# EasyEDA Pro project harvesp-rev-a.epro

# Schematic Schematic1_1
Board Name: Board1_1; Create Date: 2026-04-22; Page Name: P1; Project Name: harvesp; Schematic Name: Schematic1_1; Update Date: 2026-04-30; Company: EasyEDA.com; Page Size: A4; Version: V1.0
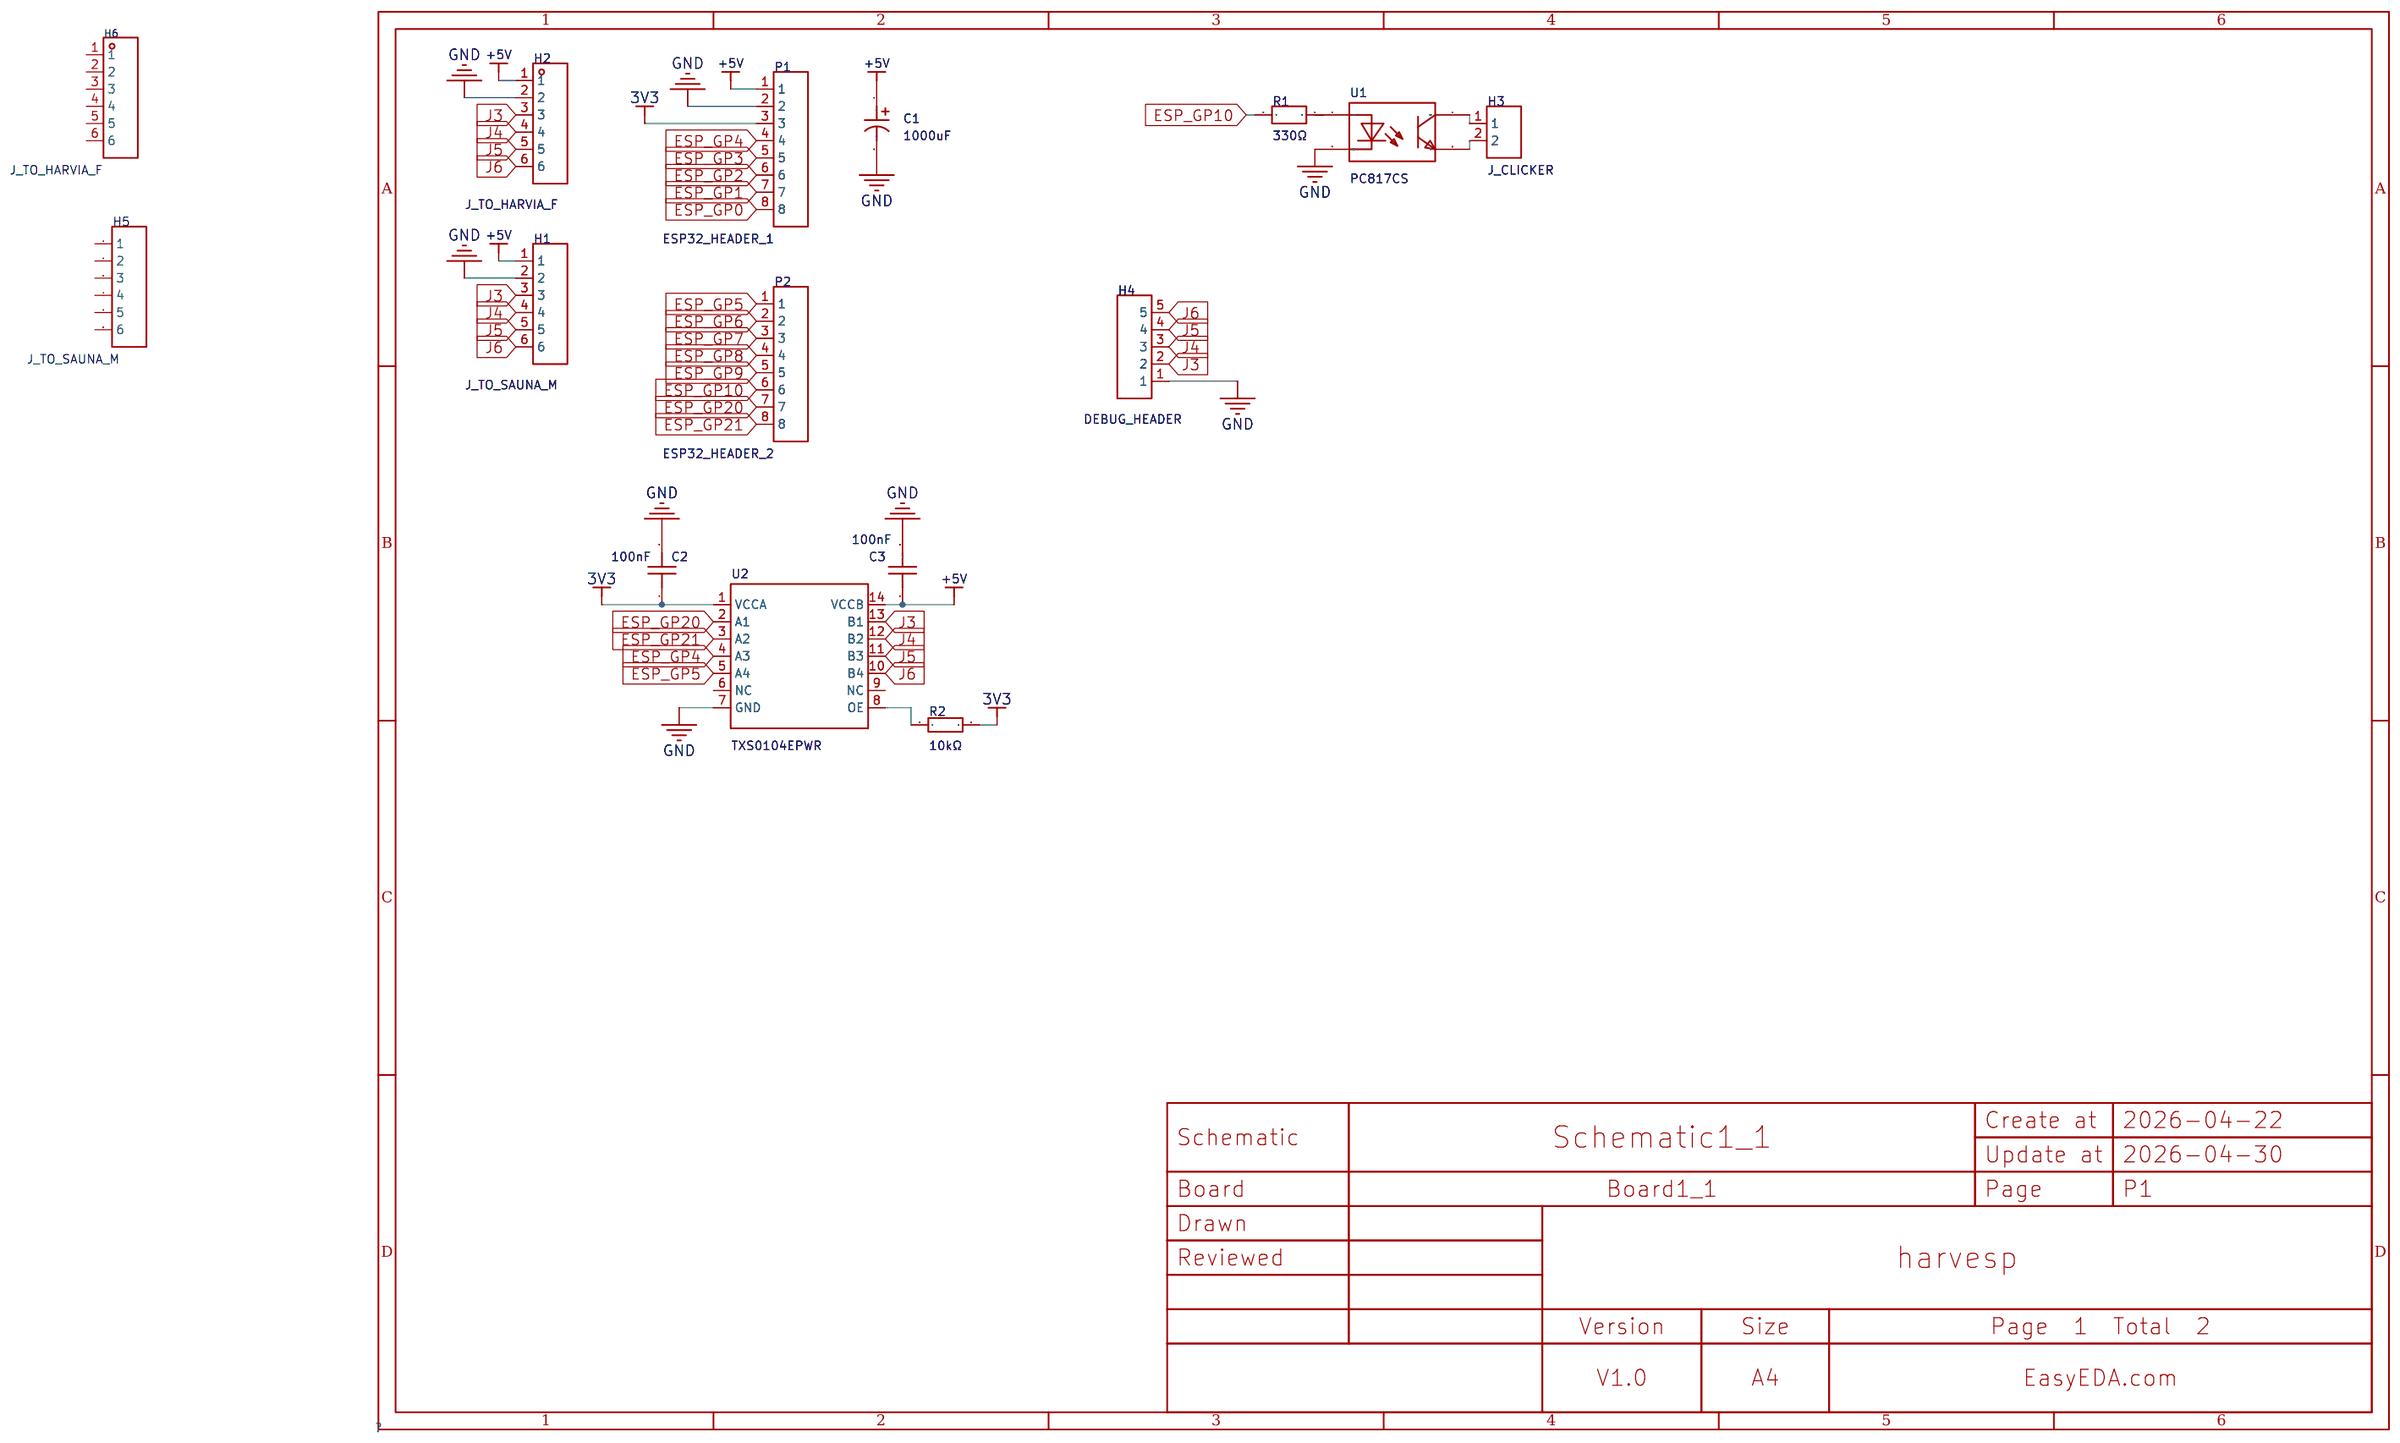
[diagram p0: schematic sheet]

## Parts
C1  1000uF  [CAP-SMD_BD8.0-L8.3-W8.3-LS9.0-FD]
C2  100nF  [C0603]
C3  100nF  [C0603]
H1  J_TO_SAUNA_M  [HDR-TH_6P-P2.54-H-M-W10.4]
H2  J_TO_HARVIA_F  [HDR-TH_6P-P2.54-H-F-W10.0-N]
H3  J_CLICKER  [HDR-TH_2P-P2.54-V-M]
H4  DEBUG_HEADER  [HDR-TH_5P-P2.54-V-M]
H5  J_TO_SAUNA_M  [HDR-TH_6P-P2.54-V-M-1]  (no BOM)
H6  J_TO_HARVIA_F  [HDR-TH_6P-P2.54-V-F]  (no BOM)
P1  ESP32_HEADER_1  [HDR-TH_8P-P2.54-V-F]
P2  ESP32_HEADER_2  [HDR-TH_8P-P2.54-V-F]
R1  330Ω  [R0805]
R2  10kΩ  [R0603]
U1  PC817CS  [SOP-4_L6.5-W4.6-P2.54-LS10.2-BL]
U2  TXS0104EPWR  [TSSOP-14_L5.0-W4.4-P0.65-LS6.4-BL]

## Library data of the parts
C1 = JVJ6.3V1000M8X10: Capacitance:1000uF Tolerance:±20% Tolerance:±20% Voltage Rating:6.3V Ripple Current:230mA@120Hz Diameter:8mm Height - Seated (Max):10.5mm Lifetime:2000hrs@105℃ Operating Temperature:-55℃~+105℃ Operating Temperature:-55℃~+105℃; LCSC Part Name: 1000uF ±20% 6.3V; Supplier Part: C49256842; Manufacturer: JIERR(捷而瑞); Supplier Footprint: SMD,D8xL10.5mm; JLCPCB Part Class: Extended Part; Datasheet: https://item.szlcsc.com/datasheet/JVJ6.3V1000M8X10/51692242.html; Supplier: LCSC; Tolerance: ±20%; Voltage Rating: 6.3V; Ripple Current: 230mA@120Hz; Diameter: 8mm; Height - Seated (Max): 10.5mm; Lifetime: 2000hrs@105℃; Operating Temperature: -55℃~+105℃
C2 C3 = TCC0603X7R104K500CT: Capacitance:100nF Tolerance:±10% Tolerance:±10% Voltage Rating:50V Temperature Coefficient:X7R; LCSC Part Name: 100nF ±10% 50V; Supplier Part: C282519; Manufacturer: CCTC(三环); Supplier Footprint: 0603; JLCPCB Part Class: Extended Part; Datasheet: https://item.szlcsc.com/datasheet/TCC0603X7R104K500CT/268639.html; Supplier: LCSC; Tolerance: ±10%; Voltage Rating: 50V; Temperature Coefficient: X7R
H1 = PZ254R-11-06P: Pin Structure:1x6P Pitch:2.54mm Row Spacing:- Circluar Pins/Square Pins:Pin Header Mounting Type:Right Angle Number of Rows:1 Number of Pins:6P Current Rating:3A Voltage Rating (Max):250V Length of Mating Pin:6mm Insulation Height:2.5mm Length of End Conn; LCSC Part Name: 1x6P 间距:2.54mm 方针 弯插; Supplier Part: C492414; Manufacturer: XFCN(兴飞); Supplier Footprint: 弯插,P=2.54mm; JLCPCB Part Class: Extended Part; Datasheet: https://item.szlcsc.com/datasheet/PZ254R-11-06P/502970.html; Supplier: LCSC; Pin Structure: 1x6P; Pitch: 2.54mm; Circluar Pins/Square Pins: Pin Header; Mounting Type: Right Angle; Number of Rows: 1; Number of Pins: 6P; Current Rating: 3A; Voltage Rating (Max): 250V; Length of Mating Pin: 6mm; Insulation Height: 2.5mm; Contact Material: Brass; Operating Temperature: -40℃~+105℃; Color: Black
H2 = PM254-1-06-W-8.5: Holes Structure:1x6P Pitch:2.54mm Row Spacing:- Circular Hole / Square Hole:Square Hole Mounting Type:Right Angle Number of Rows:1 Number of Positions:6P Current Rating:3A Voltage Rating (Max):- Holes Direction:Side Insulation Height:8.5mm Contact Materia; LCSC Part Name: 1x6P 间距:2.54mm 弯插; Supplier Part: C2897388; Manufacturer: HCTL(华灿天禄); Supplier Footprint: 弯插,P=2.54mm; JLCPCB Part Class: Extended Part; Datasheet: https://item.szlcsc.com/datasheet/PM254-1-06-W-8.5/3142393.html; Supplier: LCSC; Holes Structure: 1x6P; Pitch: 2.54mm; Circular Hole / Square Hole: Square Hole; Mounting Type: Right Angle; Number of Rows: 1; Number of Positions: 6P; Current Rating: 3A; Holes Direction: Side; Insulation Height: 8.5mm; Contact Material: Copper Alloy; Operating Temperature: -40℃~+105℃
H3 = PZ254V-11-02P: Pin Structure:1x2P Pitch:2.54mm Row Spacing:- Circluar Pins/Square Pins:Pin Header Mounting Type:Through Hole Number of Rows:1 Number of Pins:2P Current Rating:3A Voltage Rating (Max):250V Length of Mating Pin:6mm Insulation Height:2.5mm Length of End Con; LCSC Part Name: 1x2P 间距:2.54mm 方针 直插; Supplier Part: C492401; Manufacturer: XFCN(兴飞); Supplier Footprint: 插件,P=2.54mm; JLCPCB Part Class: Extended Part; Datasheet: https://item.szlcsc.com/datasheet/PZ254V-11-02P/502957.html; Supplier: LCSC; Pin Structure: 1x2P; Pitch: 2.54mm; Circluar Pins/Square Pins: Pin Header; Mounting Type: Through Hole; Number of Rows: 1; Number of Pins: 2P; Current Rating: 3A; Voltage Rating (Max): 250V; Length of Mating Pin: 6mm; Insulation Height: 2.5mm; Length of End Connection Pin: 3mm; Contact Material: Brass; Operating Temperature: -40℃~+105℃; Color: Black
H4 = PZ254V-11-05P: Pin Structure:1x5P Pitch:2.54mm Row Spacing:- Circluar Pins/Square Pins:Pin Header Mounting Type:Through Hole Number of Rows:1 Number of Pins:5P Current Rating:3A Voltage Rating (Max):250V Length of Mating Pin:6mm Insulation Height:2.5mm Length of End Con; LCSC Part Name: 1x5P 间距:2.54mm 方针 直插; Supplier Part: C492404; Manufacturer: XFCN(兴飞); Supplier Footprint: 插件,P=2.54mm; JLCPCB Part Class: Extended Part; Datasheet: https://item.szlcsc.com/datasheet/PZ254V-11-05P/502960.html; Supplier: LCSC; Pin Structure: 1x5P; Pitch: 2.54mm; Circluar Pins/Square Pins: Pin Header; Mounting Type: Through Hole; Number of Rows: 1; Number of Pins: 5P; Current Rating: 3A; Voltage Rating (Max): 250V; Length of Mating Pin: 6mm; Insulation Height: 2.5mm; Length of End Connection Pin: 3mm; Contact Material: Brass; Operating Temperature: -40℃~+105℃; Color: Black
H5 = 2.54-1x6P直针: Pin Structure:1x6P Pitch:2.54mm Row Spacing:- Circluar Pins/Square Pins:Pin Header Mounting Type:Through Hole Number of Rows:1 Number of Pins:6P Current Rating:3A Voltage Rating (Max):- Length of Mating Pin:6mm Insulation Height:2.5mm Length of End Connec; LCSC Part Name: 1x6P 间距:2.54mm 方针 直插; Supplier Part: C37208; Manufacturer: BOOMELE(博穆精密); Supplier Footprint: 插件,P=2.54mm; JLCPCB Part Class: Extended Part; Datasheet: https://item.szlcsc.com/datasheet/2.54-1x6P%25E7%259B%25B4%25E9%2592%2588/38187.html; Supplier: LCSC; Pin Structure: 1x6P; Pitch: 2.54mm; Circluar Pins/Square Pins: Pin Header; Mounting Type: Through Hole; Number of Rows: 1; Number of Pins: 6P; Current Rating: 3A; Length of Mating Pin: 6mm; Insulation Height: 2.5mm; Length of End Connection Pin: 3mm; Contact Material: Brass; Contact Plating: Gold; Operating Temperature: -40℃~+105℃; Color: Black
H6 = PM254V-11-06-H85: Holes Structure:1x6P Pitch:2.54mm Row Spacing:- Circular Hole / Square Hole:Square Hole Mounting Type:Through Hole Number of Rows:1 Number of Positions:6P Current Rating:3A Voltage Rating (Max):250V Holes Direction:Top Insulation Height:- Operating Temper; LCSC Part Name: 间距:2.54mm 1x6P 直插; Supplier Part: C2832269; Manufacturer: XFCN(兴飞); Supplier Footprint: 插件,P=2.54mm; JLCPCB Part Class: Extended Part; Datasheet: https://item.szlcsc.com/datasheet/PM254V-11-06-H85/2989787.html; Supplier: LCSC; Holes Structure: 1x6P; Pitch: 2.54mm; Circular Hole / Square Hole: Square Hole; Mounting Type: Through Hole; Number of Rows: 1; Number of Positions: 6P; Current Rating: 3A; Voltage Rating (Max): 250V; Holes Direction: Top; Operating Temperature: -40℃~+105℃
P1 P2 = 2.54-1*8P母环保: Holes Structure:1x8P Pitch:2.54mm Row Spacing:- Circular Hole / Square Hole:Square Hole Mounting Type:Through Hole Number of Rows:1 Number of Positions:8P Current Rating:3A Holes Direction:Top Insulation Height:8.5mm Contact Material:Brass Contact Plating; LCSC Part Name: 1x8P 间距:2.54mm 直插; Supplier Part: C27438; Manufacturer: BOOMELE(博穆精密); Supplier Footprint: 插件,P=2.54mm; JLCPCB Part Class: Extended Part; Datasheet: https://item.szlcsc.com/datasheet/2.54-1*8P%25E6%25AF%258D%25E7%258E%25AF%25E4%25BF%259D/28187.html; Supplier: LCSC; Holes Structure: 1x8P; Pitch: 2.54mm; Circular Hole / Square Hole: Square Hole; Mounting Type: Through Hole; Number of Rows: 1; Number of Positions: 8P; Current Rating: 3A; Holes Direction: Top; Insulation Height: 8.5mm; Contact Material: Brass; Contact Plating: Gold; Operating Temperature: -55℃~+105℃; PIN Length: 3.2mm
R1 = FRC0805J331 TS: Type:Thick Film Resistor Resistance:330Ω Tolerance:±5% Tolerance:±5% Power(Watts):125mW Voltage-Supply(Max):150V Temperature Coefficient:±100ppm/℃ Temperature Coefficient:±100ppm/℃ Operating Temperature:-55℃~+155℃ Operating Temperature:-55℃~+155℃; LCSC Part Name: 330Ω ±5% 125mW 厚膜电阻; Supplier Part: C2907321; Manufacturer: FOJAN(富捷); Supplier Footprint: 0805; JLCPCB Part Class: Extended Part; Supplier: LCSC; Type: Thick Film Resistor; Tolerance: ±5%; Power(Watts): 125mW; Voltage-Supply(Max): 150V; Temperature Coefficient: ±100ppm/℃; Operating Temperature: -55℃~+155℃
R2 = RC0603FR-0710KL: Type:Thick Film Resistors Resistance: Tolerance:±1% Tolerance:±1% Power(Watts): Overload Voltage (Max): Temperature Coefficient:±100ppm/℃ Temperature Coefficient:±100ppm/℃ Operating Temperature Range:-55℃~+155℃ Operating Temperature Range:-55℃~+155℃; LCSC Part Name: 厚膜电阻 10kΩ ±1% 100mW; Supplier Part: C98220; Manufacturer: YAGEO(国巨); Supplier Footprint: 0603; JLCPCB Part Class: Extended Part; Datasheet: https://atta.szlcsc.com/upload/public/pdf/source/20180927/C295883_E8D83085EA81BD7DE0B2B681138C15EE.pdf; Supplier: LCSC; Type: Thick Film Resistors; Tolerance: ±1%; Temperature Coefficient: ±100ppm/℃; Operating Temperature Range: -55℃~+155℃
U1 = PC817CS: Input type:DC Output Type:Phototransistor Voltage - Forward(Vf):1.2V Output Current:50mA Isolation Voltage(Vrms):5kV Reverse Voltage:6V Load Voltage:80V Number of Outputs:1 Vce Saturation(VCE(sat)):200mV@1mA,20mA Rise time:4us Fall time:3us Operating Temp; LCSC Part Name: 光耦-光电晶体管输出; Supplier Part: C20612591; Manufacturer: AOTE(奥特); Supplier Footprint: SOP-4; JLCPCB Part Class: Extended Part; Datasheet: https://item.szlcsc.com/datasheet/PC817CS/21971734.html; Supplier: LCSC; Input type: DC; Output Type: Phototransistor; Voltage - Forward(Vf): 1.2V; Output Current: 50mA; Isolation Voltage(Vrms): 5kV; Reverse Voltage: 6V; Load Voltage: 80V; Number of Outputs: 1; Vce Saturation(VCE(sat)): 200mV@1mA,20mA; Rise time: 4us; Fall time: 3us; Operating Temperature: -55℃~+110℃; Current Transfer Ratio (CTR) Minimum: 80%; Current Transfer Ratio (CTR) Maximum/Saturation Value: 600%; Forward Current(If): 50mA
U2 = TXS0104EPWR: Channel Type:Bidirectional Data Rate:24Mbps Voltage - Supply(VCCA):1.65V~3.6V Voltage - Supply(VCCA):1.65V~3.6V Voltage - Supply(VCCB):2.3V~5.5V Voltage - Supply(VCCB):2.3V~5.5V Number of Elements:1 Number of Circuits:4 Output Type:Push-Pull；Open Drain Op; LCSC Part Name: 4位双向电压电平转换器; Supplier Part: C44955; Manufacturer: TI(德州仪器); Supplier Footprint: TSSOP-14; JLCPCB Part Class: Extended Part; Datasheet: https://www.ti.com/cn/lit/gpn/txs0104e; Supplier: LCSC; Channel Type: Bidirectional; Data Rate: 24Mbps; Voltage - Supply(VCCA): 1.65V~3.6V; Voltage - Supply(VCCB): 2.3V~5.5V; Number of Elements: 1; Number of Circuits: 4; Output Type: Push-Pull；Open Drain; Operating Temperature: -40℃~+85℃; Features: Auto Direction Detection

## Nets
3V3: C2.1 P1.3 R2.2 U2.1(VCCA)
+5V: C1.1 C3.1 H1.1 H2.1 P1.1 U2.14(VCCB)
GND: C1.2 C2.2 C3.2 H1.2 H2.2 H4.1 P1.2 U1.2(Cathode) U2.7(GND)
ESP_GP0: P1.8
ESP_GP1: P1.7
ESP_GP2: P1.6
ESP_GP3: P1.5
ESP_GP4: P1.4 U2.4(A3)
ESP_GP5: P2.1 U2.5(A4)
ESP_GP6: P2.2
ESP_GP7: P2.3
ESP_GP8: P2.4
ESP_GP9: P2.5
ESP_GP10: P2.6 R1.2
ESP_GP20: P2.7 U2.2(A1)
ESP_GP21: P2.8 U2.3(A2)
J3: H1.3 H2.3 H4.2 U2.13(B1)
J4: H1.4 H2.4 H4.3 U2.12(B2)
J5: H1.5 H2.5 H4.4 U2.11(B3)
J6: H1.6 H2.6 H4.5 U2.10(B4)
$1N1895: R1.1 U1.1(Anode)
$1N1904: H3.1 U1.4(Collector)
$1N1911: H3.2 U1.3(Emitter)
$1N3117: R2.1 U2.8(OE)

Not connected (* = marked no-connect by the designer): H5 1 2 3 4 5 6; H6 1 2 3 4 5 6; U2 6(NC) 9(NC)

# Board PCB1_1
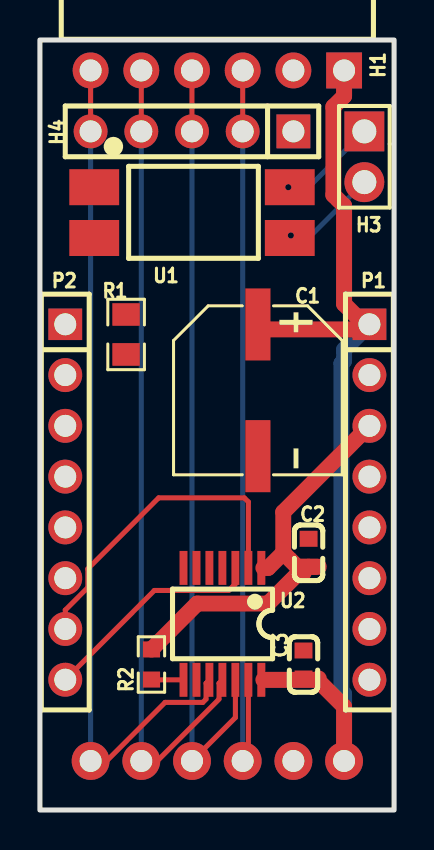
[diagram p1: board, top side]
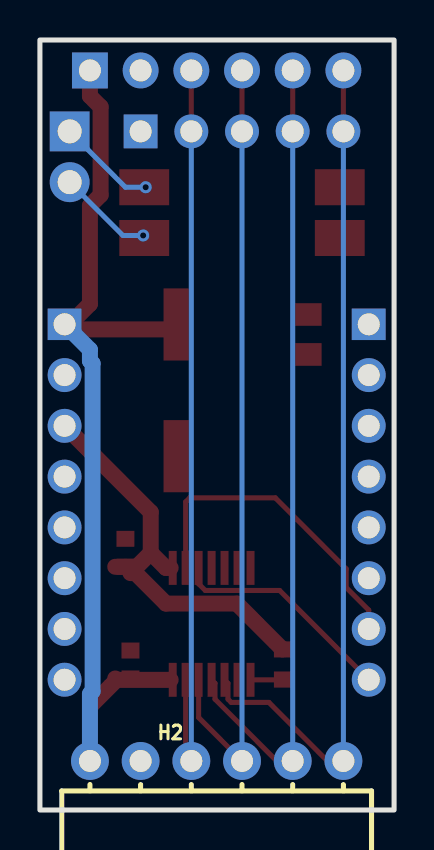
[diagram p2: board, bottom side, seen from below]

Outline 17.75 x 38.52 mm; copper layers: Top Layer, Bottom Layer. Coordinates in mm from the lower left corner of the outline.
Outline path: rectangle 0,38.52 17.75,0
Stack: Top Layer 0.035mm / Dielectric1 1.51mm FR4 er 4.5 / Bottom Layer 0.035mm

## Design rules (mm)
spacing copperThickness1oz (default): track to track 0.102, other pairs 0.152 to 0.3
spacing copperThickness2oz: track to track 0.203, other pairs 0.152 to 0.3
spacing Plane_innerPlane: track to track 0.102, other pairs 0.152 to 0.3
spacing Copper_copperRegion: track to track 0.102, other pairs 0.152 to 0.3
track width copperThickness1oz (default): min 0.127, default 0.254, max 2.54
track width copperThickness2oz: min 0.203, default 0.254, max 2.54
track width power0.8mm: min 0.254, default 0.8, max 2.54
differential pair differentialPair (default): width min 0.127, default 0.254, max 2.54; gap min 0.152, default 0.152
net +5V uses power0.8mm
net 3V3 uses power0.8mm

## Placement (name value [footprint] x y rotation side)
C1  1000uF  [CAP-SMD_BD8.0-L8.3-W8.3-LS9.0-FD]  10.92 21 270 top
C2  100nF  [C0603]  13.46 12.87 90 top
C3  100nF  [C0603]  13.21 7.28 90 top
H1  J_TO_SAUNA_M  [HDR-TH_6P-P2.54-H-M-W10.4]  8.89 37 180 top
H2  J_TO_HARVIA_F  [HDR-TH_6P-P2.54-H-F-W10.0-N]  8.89 2.45 180 bottom
H3  J_CLICKER  [HDR-TH_2P-P2.54-V-M]  16.26 32.68 270 top
H4  DEBUG_HEADER  [HDR-TH_5P-P2.54-V-M]  7.62 33.95 180 top
P1  ESP32_HEADER_1  [HDR-TH_8P-P2.54-V-F]  16.51 15.41 270 top
P2  ESP32_HEADER_2  [HDR-TH_8P-P2.54-V-F]  1.27 15.41 270 top
R1  330Ω  [R0805]  4.32 23.79 270 top
R2  10kΩ  [R0603]  5.59 7.28 90 top
U1  PC817CS  [SOP-4_L6.5-W4.6-P2.54-LS10.2-BL]  7.62 29.89 270 top
U2  TXS0104EPWR  [TSSOP-14_L5.0-W4.4-P0.65-LS6.4-BL]  9.14 9.31 180 top

## Footprints (pads in the part's own frame, mm; a bottom-side part is the same pattern mirrored in y, then rotated)
C0603
  rect 0.8x0.9 smd: 1(-0.7,0) 2(0.7,0)
CAP-SMD_BD8.0-L8.3-W8.3-LS9.0-FD
  rect 3.61x1.26 smd: 1(-3.295,0) 2(3.295,0)
HDR-TH_2P-P2.54-V-M
  rect 2x2 hole 1.2: 1(-1.27,0)
  round 2 hole 1.2: 2(1.27,0)
HDR-TH_5P-P2.54-V-M
  rect 1.7x1.7 hole 1.1: 1(-5.08,0)
  round 1.7 hole 1.1: 2(-2.54,0) 3(0,0) 4(2.54,0) 5(5.08,0)
HDR-TH_6P-P2.54-H-F-W10.0-N
  round 1.9 hole 1.1: 1(-6.35,0) 2(-3.81,0) 3(-1.27,0) 4(1.27,0) 5(3.81,0) 6(6.35,0)
HDR-TH_6P-P2.54-H-M-W10.4
  rect 1.8x1.8 hole 1.1: 1(-6.35,0)
  round 1.8 hole 1.1: 2(-3.81,0) 3(-1.27,0) 4(1.27,0) 5(3.81,0) 6(6.35,0)
HDR-TH_8P-P2.54-V-F
  rect 1.575x1.7 hole 1.1: 1(-8.89,0)
  round 1.7 hole 1.1: 2(-6.35,0) 3(-3.81,0) 4(-1.27,0) 5(1.27,0) 6(3.81,0) 7(6.35,0) 8(8.89,0)
R0603
  rect 0.806x0.864 smd: 1(-0.753,0) 2(0.753,0)
R0805
  rect 1.133x1.377 smd: 1(-1,0) 2(1,0)
SOP-4_L6.5-W4.6-P2.54-LS10.2-BL
  rect 1.8x2.5 smd: 1(-1.27,-4.9) 2(1.27,-4.9) 3(1.27,4.9) 4(-1.27,4.9)
TSSOP-14_L5.0-W4.4-P0.65-LS6.4-BL
  rect 0.4x1.7 smd: 1(-1.95,-2.8) 2(-1.3,-2.8) 3(-0.65,-2.8) 4(0,-2.8) 5(0.65,-2.8) 6(1.3,-2.8) 7(1.95,-2.8) 8(1.95,2.8) 9(1.3,2.8) 10(0.65,2.8) 11(0,2.8) 12(-0.65,2.8) 13(-1.3,2.8) 14(-1.95,2.8)

## Nets
As in the schematic.

Pads without a net: U2 6 9

## Via types
v1: diameter 0.61, hole 0.305, Top Layer to Bottom Layer, 2 vias

## Routing (per net, layer and track width the routed paths; a pad name or vN(x,y) marks a point on that pad's centre or on a via; arc(x,y) is an arc through that point)
3V3: length 20.7
  Top Layer w0.8: R2.2 7.88,10.33 11.43,10.33 12.95,11.85 13.21,11.85 ; 12.19,12.87 12.89,12.17 C2.1 13.97,12.17 ; 12.19,12.87 12.19,14.9 P1.3 ; 12.19,12.87 11.44,12.11 11.2,12.11
+5V: length 48.8
  Top Layer w0.8: 11.2,6.51 13.9,6.51 ; 13.9,6.51 15.24,5.17 H2.1 ; 13.9,6.51 13.97,6.58 ; 16.26,24.3 15.24,25.31 15.24,30.23 14.7,30.77 14.7,35.18 15.24,35.71 H1.1 ; 16.26,24.04 10.92,24.04
  Bottom Layer w0.8: P1.1 15.24,23.03 15.24,22.47 15.11,22.34 15.11,5.94 15.24,5.81 H2.1
ESP_GP20: length 16.4
  Top Layer w0.254: U2.2 10.44,15.41 10.24,15.62 5.95,15.62 2.4,12.07 2.4,11.13 1.27,10 P2.7
ESP_GP21: length 11.3
  Top Layer w0.254: U2.3 9.79,11.32 9.46,10.98 5.74,10.98 P2.8
J3: length 38.7
  Top Layer w0.254: U2.13 10.44,2.74 H2.3 ; H1.3 H4.2
  Bottom Layer w0.254: H4.2 H2.3
J4: length 39.5
  Top Layer w0.254: H2.4 9.79,4.63 U2.12 ; H1.4 H4.3
  Bottom Layer w0.254: H4.3 H2.4
J5: length 40.8
  Top Layer w0.254: U2.11 8.97,6.34 8.97,5.55 5.88,2.45 H2.5 ; H1.5 H4.4
  Bottom Layer w0.254: H4.4 H2.5
J6: length 42.6
  Top Layer w0.254: U2.10 8.32,6.34 8.32,5.55 8.16,5.38 6.27,5.38 3.34,2.45 H2.6 ; H1.6 H4.5
  Bottom Layer w0.254: H4.5 H2.6
$1N1904: length 5
  Bottom Layer w0.254: v1(12.45,31.16) 13.46,31.16 H3.1
$1N1911: length 4.8
  Bottom Layer w0.254: v1(12.57,28.74) 13.59,28.74 H3.2
$1N3117: length 1.6
  Top Layer w0.254: U2.8 5.6,6.51 R2.1
